# Altium schematic sheet rp2040.SchDoc
size A3
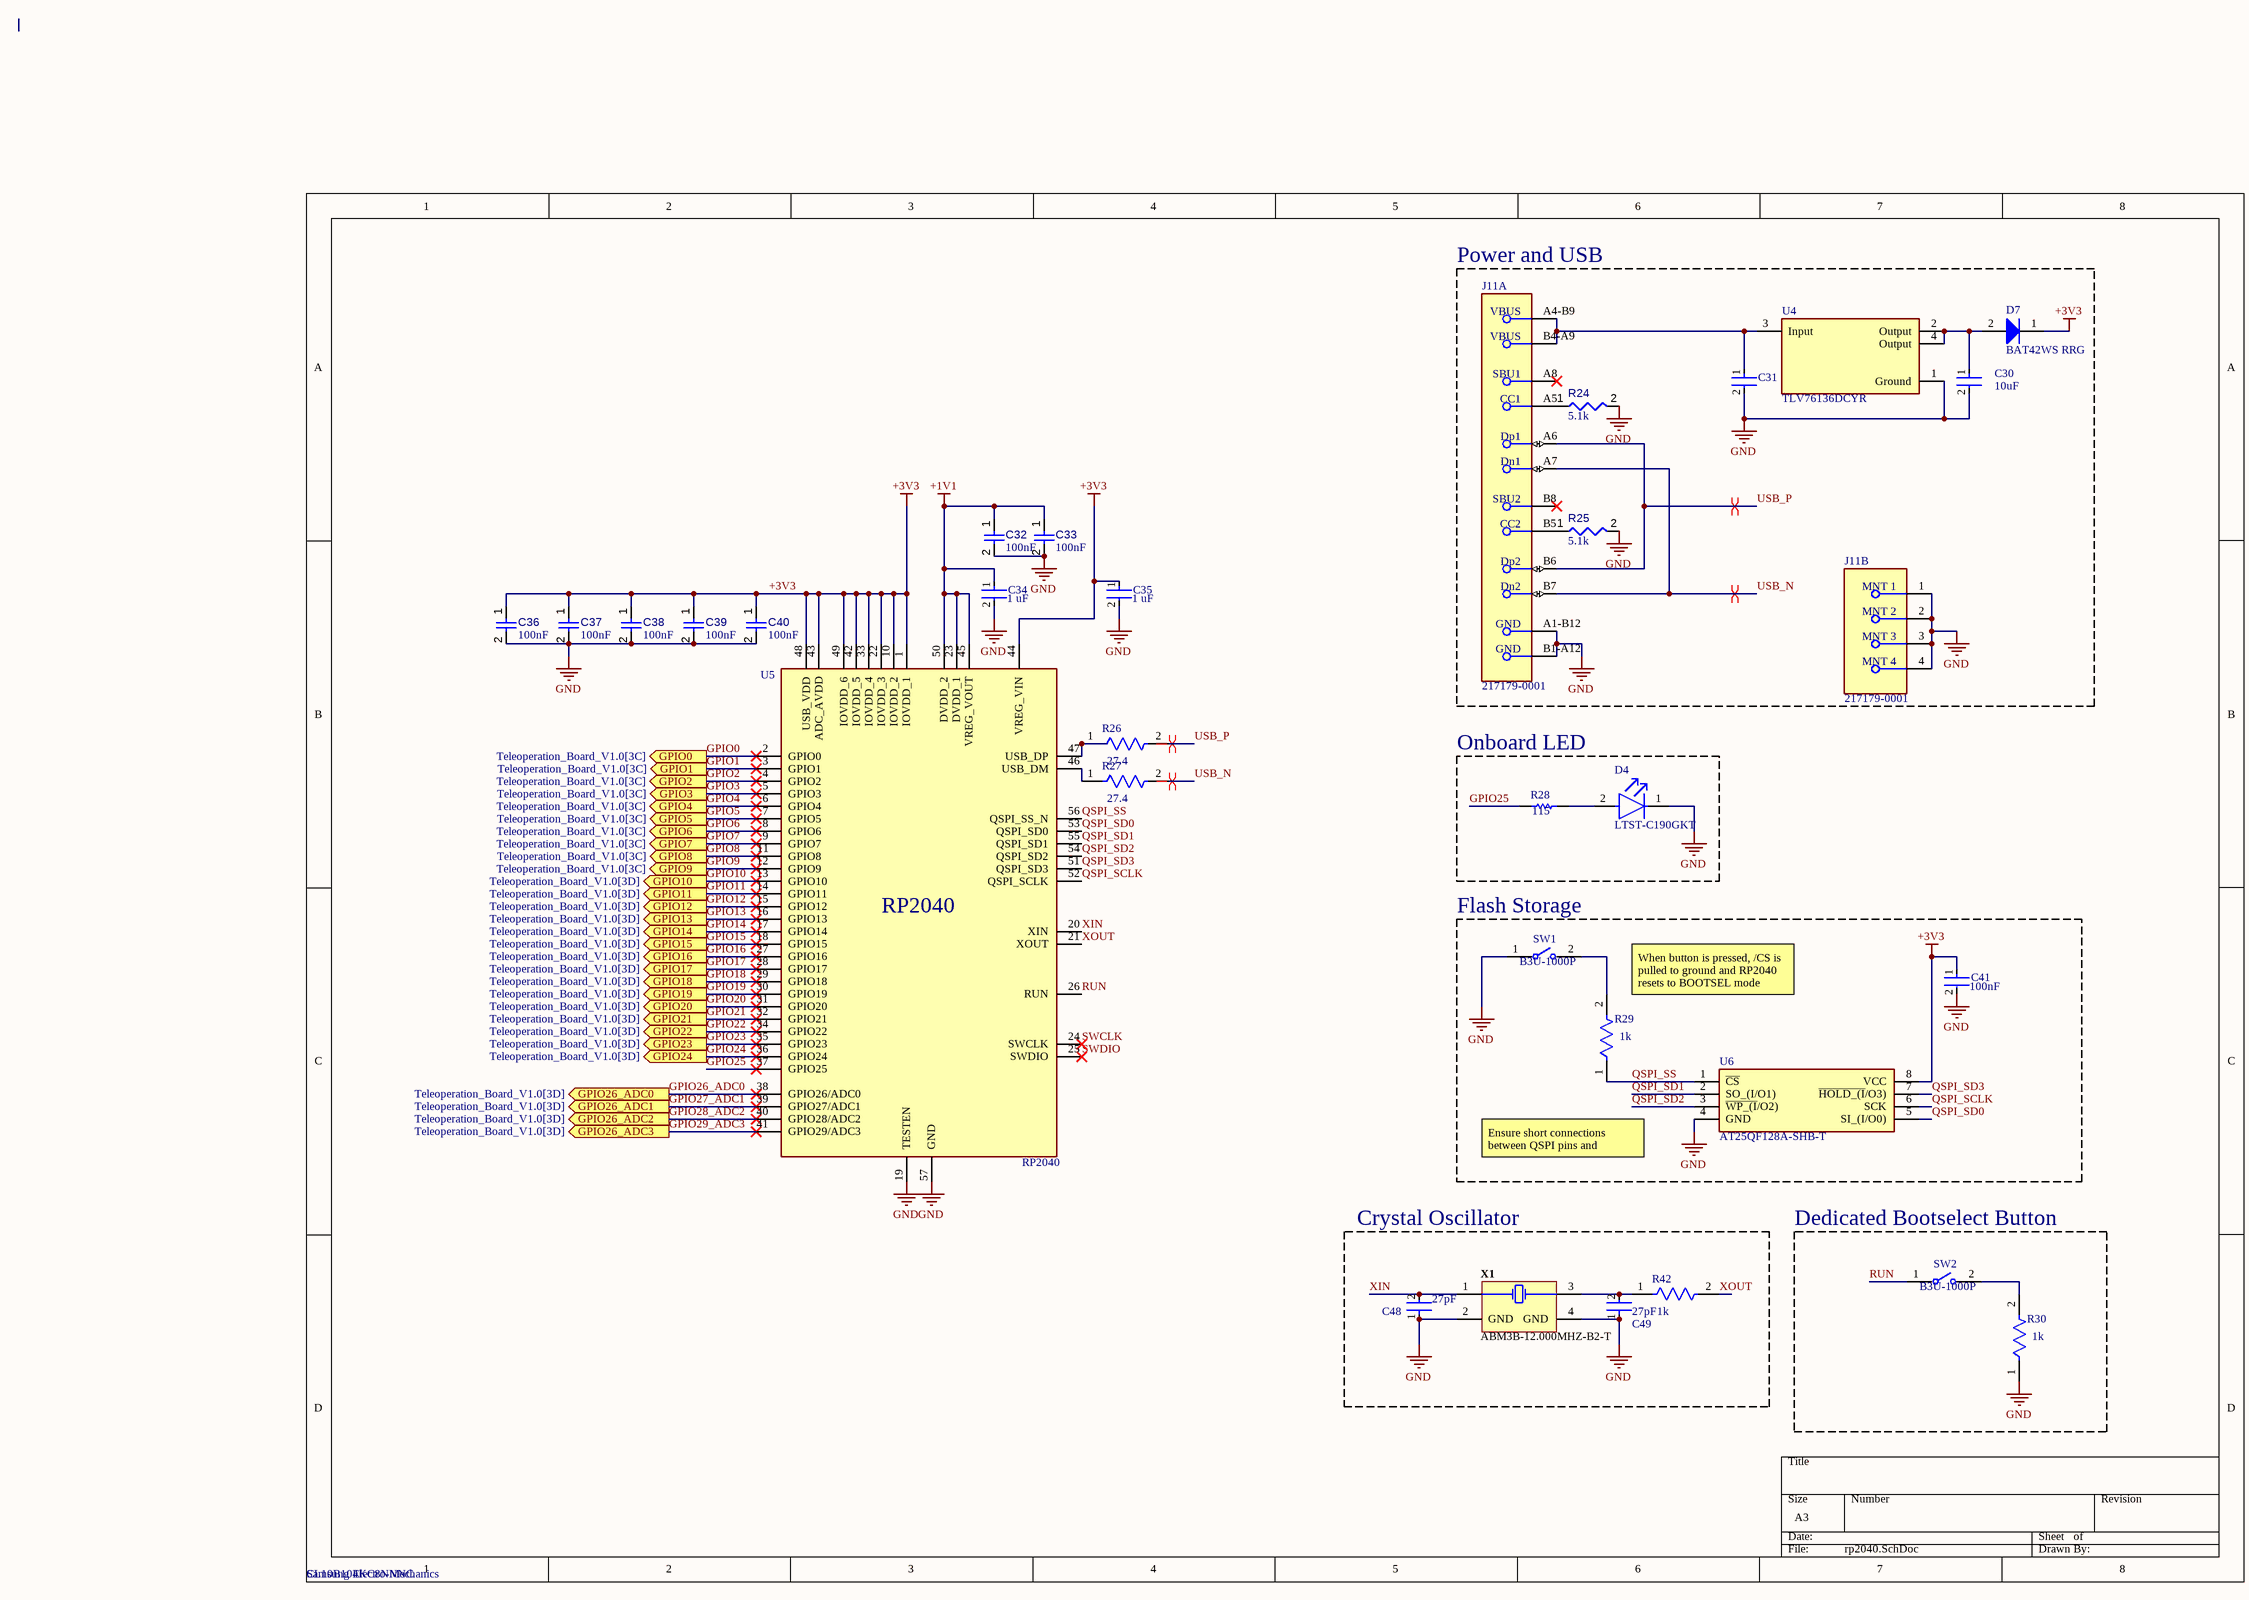
[diagram p0: rp2040.SchDoc]

## Parts
C30  Capacitance: 10uF  [FP-GRT188-0_2-MFG]  (hidden comment: GRT188R61E106ME13D)
C31  UMK107AB7105KA-T  [FP-0603-L_1_6_0_15-W_0_8-IPC_C]  (value not drawn)
C32  value 100nF  [CAPC1608X90N]  (hidden comment: CL10B104KC8NNNC)
C33  value 100nF  [CAPC1608X90N]  (hidden comment: CL10B104KC8NNNC)
C34  CC0603KPX7R7BB105  [FP-CC0603-DA-MFG]  (value not drawn)
C35  CC0603KPX7R7BB105  [FP-CC0603-DA-MFG]  (value not drawn)
C36  value 100nF  [CAPC1608X90N]  (hidden comment: CL10B104KC8NNNC)
C37  value 100nF  [CAPC1608X90N]  (hidden comment: CL10B104KC8NNNC)
C38  value 100nF  [CAPC1608X90N]  (hidden comment: CL10B104KC8NNNC)
C39  value 100nF  [CAPC1608X90N]  (hidden comment: CL10B104KC8NNNC)
C40  value 100nF  [CAPC1608X90N]  (hidden comment: CL10B104KC8NNNC)
C41  Manufacturer: Samsung Electro-Mechanics  [FP-CGA3E-0_3-0_1-IPC_A]  (hidden comment: CL10B104KC8NNNC)
C48  C0603C270J5GACTU  [FP-C0603C-CF-MFG]  (value not drawn)
C49  C0603C270J5GACTU  [FP-C0603C-CF-MFG]  (value not drawn)
D4  LTST-C190GKT  [FP-LTST-C190GKT-MFG]
D7  BAT42WS RRG  [BAT42WS RRG-Footprint-1]
J11  217179-0001  [FP-2171790001-MFG]  (parts A,B of 2)
R24  value 5.1k  [RESC1608X55N]  (hidden comment: ERJ-3EKF5101V)
R25  value 5.1k  [RESC1608X55N]  (hidden comment: ERJ-3EKF5101V)
R26  CRCW060327R4FKEA  [FP-CRCW0603-e3-MFG]  (value not drawn)
R27  CRCW060327R4FKEA  [FP-CRCW0603-e3-MFG]  (value not drawn)
R28  ERJ-3EKF1150V  [RESC1608X55X30NL15T15]  (value not drawn)
R29  RC0603FR-071KL  [FP-RC0603-0_55-IPC_C]  (value not drawn)
R30  RC0603FR-071KL  [FP-RC0603-0_55-IPC_C]  (value not drawn)
R42  RC0603FR-071KL  [FP-RC0603-0_55-IPC_C]  (value not drawn)
SW1  B3U-1000P  [FP-B3U-1000P-MFG]
SW2  B3U-1000P  [FP-B3U-1000P-MFG]
U4  TLV76136DCYR  [TLV76136DCYR-Footprint-1]
U5  RP2040  [RP2040TR7]
U6  AT25QF128A-SHB-T  [SOIC127P790X216-8N]
X1  ABM3B-12.000MHZ-B2-T  [ABRA-ABM3B-4_V]

## Blocks framed on the sheet
Power and USB: C30 C31 D7 J11 R24 R25 U4
Onboard LED: D4 R28
Flash Storage: C41 R29 SW1 U6
Crystal Oscillator: C48 C49 R42 X1
Dedicated Bootselect Button: R30 SW2

## Ports
GPIO0 (out, see Teleoperation_Board_V1.0[3C]), GPIO1 (out, see Teleoperation_Board_V1.0[3C]), GPIO2 (out, see Teleoperation_Board_V1.0[3C]), GPIO3 (out, see Teleoperation_Board_V1.0[3C]), GPIO4 (out, see Teleoperation_Board_V1.0[3C]), GPIO5 (out, see Teleoperation_Board_V1.0[3C]), GPIO6 (out, see Teleoperation_Board_V1.0[3C]), GPIO7 (out, see Teleoperation_Board_V1.0[3C]), GPIO8 (out, see Teleoperation_Board_V1.0[3C]), GPIO9 (out, see Teleoperation_Board_V1.0[3C]), GPIO10 (out, see Teleoperation_Board_V1.0[3D]), GPIO11 (out, see Teleoperation_Board_V1.0[3D]), GPIO12 (out, see Teleoperation_Board_V1.0[3D]), GPIO13 (out, see Teleoperation_Board_V1.0[3D]), GPIO14 (out, see Teleoperation_Board_V1.0[3D]), GPIO15 (out, see Teleoperation_Board_V1.0[3D]), GPIO16 (out, see Teleoperation_Board_V1.0[3D]), GPIO17 (out, see Teleoperation_Board_V1.0[3D]), GPIO18 (out, see Teleoperation_Board_V1.0[3D]), GPIO19 (out, see Teleoperation_Board_V1.0[3D]), GPIO20 (out, see Teleoperation_Board_V1.0[3D]), GPIO21 (out, see Teleoperation_Board_V1.0[3D]), GPIO22 (out, see Teleoperation_Board_V1.0[3D]), GPIO23 (out, see Teleoperation_Board_V1.0[3D]), GPIO24 (out, see Teleoperation_Board_V1.0[3D]), GPIO26_ADC0 (out, see Teleoperation_Board_V1.0[3D]), GPIO26_ADC1 (out, see Teleoperation_Board_V1.0[3D]), GPIO26_ADC2 (out, see Teleoperation_Board_V1.0[3D]), GPIO26_ADC3 (out, see Teleoperation_Board_V1.0[3D])

## Nets
+1V1: C32.1 C33.1 C34.1 U5.23(DVDD_1) U5.45(VREG_VOUT) U5.50(DVDD_2)
+3V3: C35.1 C36.1 C37.1 C38.1 C39.1 C40.1 C41.1 D7.1(K) U5.1(IOVDD_1) U5.10(IOVDD_2) U5.22(IOVDD_3) U5.33(IOVDD_4) U5.42(IOVDD_5) U5.43(ADC_AVDD) U5.44(VREG_VIN) U5.48(USB_VDD) U5.49(IOVDD_6) U6.8(VCC)
GND: C30.2 C31.2 C32.2 C33.2 C34.2 C35.2 C36.2 C37.2 C38.2 C39.2 C40.2 C41.2 C48.1 C49.1 D4.1(C) J11.1(MNT_1) J11.2(MNT_2) J11.3(MNT_3) J11.4(MNT_4) J11.A1-B12(GND) J11.B1-A12(GND) R24.2 R25.2 R30.1 SW1.1 U4.1(Ground) U5.19(TESTEN) U5.57(GND) U6.4(GND) X1.2(GND) X1.4(GND)
GPIO0: U5.2(GPIO0) ; port GPIO0
GPIO1: U5.3(GPIO1) ; port GPIO1
GPIO2: U5.4(GPIO2) ; port GPIO2
GPIO3: U5.5(GPIO3) ; port GPIO3
GPIO4: U5.6(GPIO4) ; port GPIO4
GPIO5: U5.7(GPIO5) ; port GPIO5
GPIO6: U5.8(GPIO6) ; port GPIO6
GPIO7: U5.9(GPIO7) ; port GPIO7
GPIO8: U5.11(GPIO8) ; port GPIO8
GPIO9: U5.12(GPIO9) ; port GPIO9
GPIO10: U5.13(GPIO10) ; port GPIO10
GPIO11: U5.14(GPIO11) ; port GPIO11
GPIO12: U5.15(GPIO12) ; port GPIO12
GPIO13: U5.16(GPIO13) ; port GPIO13
GPIO14: U5.17(GPIO14) ; port GPIO14
GPIO15: U5.18(GPIO15) ; port GPIO15
GPIO16: U5.27(GPIO16) ; port GPIO16
GPIO17: U5.28(GPIO17) ; port GPIO17
GPIO18: U5.29(GPIO18) ; port GPIO18
GPIO19: U5.30(GPIO19) ; port GPIO19
GPIO20: U5.31(GPIO20) ; port GPIO20
GPIO21: U5.32(GPIO21) ; port GPIO21
GPIO22: U5.34(GPIO22) ; port GPIO22
GPIO23: U5.35(GPIO23) ; port GPIO23
GPIO24: U5.36(GPIO24) ; port GPIO24
GPIO25: R28.1 U5.37(GPIO25)
GPIO26_ADC0: U5.38(GPIO26/ADC0) ; port GPIO26_ADC0
GPIO27_ADC1: U5.39(GPIO27/ADC1) ; port GPIO26_ADC1
GPIO28_ADC2: U5.40(GPIO28/ADC2) ; port GPIO26_ADC2
GPIO29_ADC3: U5.41(GPIO29/ADC3) ; port GPIO26_ADC3
QSPI_SCLK: U5.52(QSPI_SCLK) U6.6(SCK)
QSPI_SD0: U5.53(QSPI_SD0) U6.5(SI_(I/O0))
QSPI_SD1: U5.55(QSPI_SD1) U6.2(SO_(I/O1))
QSPI_SD2: U5.54(QSPI_SD2) U6.3(~{WP_(I}/O2))
QSPI_SD3: U5.51(QSPI_SD3) U6.7(~{HOLD_(I}/O3))
QSPI_SS: R29.1 U5.56(QSPI_SS_N) U6.1(~{CS})
RUN: SW2.1 U5.26(RUN)
SWCLK: U5.24(SWCLK)
SWDIO: U5.25(SWDIO)
USB_N: J11.A7(Dn1) J11.B7(Dn2) R27.2
USB_P: J11.A6(Dp1) J11.B6(Dp2) R26.2
XIN: C48.2 U5.20(XIN) X1.1(X1)
XOUT: R42.2 U5.21(XOUT)
NetC30_1: C30.1 D7.2(A) U4.2(Output) U4.4(Output)
NetC31_1: C31.1 J11.A4-B9(VBUS) J11.B4-A9(VBUS) U4.3(Input)
NetC49_2: C49.2 R42.1 X1.3(X2)
NetD4_2: D4.2(A) R28.2
NetJ11_A5: J11.A5(CC1) R24.1
NetJ11_B5: J11.B5(CC2) R25.1
NetR26_1: R26.1 U5.47(USB_DP)
NetR27_1: R27.1 U5.46(USB_DM)
NetR29_2: R29.2 SW1.2
NetR30_2: R30.2 SW2.2

Not connected (* = marked no-connect by the designer): J11 A8(SBU1)* B8(SBU2)*

## Layout directives
differential pair: (no net found under the mark), USB_N, USB_P

## Notes on the sheet
- (near C34) 1 uF
- (near C35) 1 uF
- 27.4
- (near R27) 27.4
- (near R28) 115
- (near U5) RP2040
- (near R29) 1k
- (near R29) When button is pressed, /CS is pulled to ground and RP2040 resets to BOOTSEL mode
- (near C41) 100nF
- Ensure short connections between QSPI pins and RP2040
- (near C48) 27pF
- 27pF
- (near R42) 1k
- (near R30) 1k

## Library data of the parts
C30 = CMP-06035-032378-1: Multi-Layer Ceramic Capacitor 10uF 25V X5R ±20% 0603 Paper T/R; Thickness: 0.035inch; Case/Package: 0603; Voltage Rating: 25V; Mount: Surface Mount; Packaging: Tape and Reel; Width: 0.031inch; Max Operating Temperature: 85°C; Case Code (Imperial): 0603; Ratings: AEC-Q200; Tolerance: 20%; Min Operating Temperature: -55°C; Case Code (Metric): 1608; Length: 0.063inch
C31 = CMP-2000-07531-4: Ceramic Capacitor General Use 1uF ±10% 50V X7R 0603; Series: M; Width: 0.031inch; Mount: Surface Mount; Radiation Hardening: No; Voltage Rating (DC): 50V; Packaging: Tape and Reel; Termination: SMD/SMT; Depth: 0.8mm; Case Code (Metric): 1608; Case Code (Imperial): 0603; Height: 0.8mm; Voltage Rating: 50V; Package Quantity: 1; Halogen Free: Halogen Free; Dielectric: X7R; Min Operating Temperature: -55°C; Length: 1.6mm; Construction: Flat; Tolerance: 10%; Thickness: 0.037inch; Max Operating Temperature: 125°C; Case/Package: 0603; Capacitance: 1uF; RoHS Compliant: Yes
C32 C33 C36-C40 = CMP-001-00090-1: Ceramic Capacitor, Multilayer, Ceramic, 100V, 10% +Tol, 10% -Tol, X7R, 15% TC, 0.1uF, Surface Mount, 0603; Case/Package: 0603; Min Operating Temperature: -55°C; Mounting Technology: Surface Mount; Capacitor Type: Ceramic; Max Operating Temperature: 125°C; Pins: 2; RoHS Compliant: Yes
C34 C35 = CMP-03422-001047-1: CC0603 1 uF X7R 10.00% 16 V; Manufacturer: YAGEO; Temperature Coefficient: 15%; Tolerance: 0.1; Voltage Rating: 16 V; Capacitance: 1 uF; Material: Ceramic; Value: 1 uF; Device Class L3: Ceramic Capacitors; Temperature Characteristic: X7R; Device Class L2: Capacitors; Temperature Range Low: -55°C; Footprint Url: http://www.yageo.com/exep/pages/download/literatures/UPY-C_GEN_24.pdf; Device Class L1: Passive Components; Temperature: -55°C to +125°C; RoHS: TRUE; ComponentLink2URL: http://www.yageo.com/documents/recent/UPY-GPHC_X7R_6.3V-to-50V_18.pdf; Mouser Description: Cap Ceramic 1uF 16V X7R 10% SMD 0603 125°C Paper T/R; Octopart: https://octopart.com/cc0603kpx7r7bb105-yageo-25629533; Automotive: No; Height: 0.9mm; Voltage: 16 V; Lead Free: Yes; Category: Cap; Package: CC0603-DA; Temperature Range High: +125°C; Manufacturer Part Number: CC0603KPX7R7BB105; ComponentLink2Description: Datasheet
C41 = CMP-2000-07546-2: Cap Ceramic 100nF 50V X7R 10% Pad SMD 0603 +125°C Automotive T/R; Weight: 7.1E-05oz; Composition: Ceramic; Max Operating Temperature: 125°C; Termination: SMD/SMT; Dielectric: X7R; Length: 1.6mm; Package Quantity: 1; REACH SVHC: No SVHC; Lead Free: Lead Free; Case Code (Metric): 1608; Min Operating Temperature: -55°C; Packaging: Tape and Reel; Tolerance: 10%; Voltage Rating: 50V; Case Code (Imperial): 0603; Capacitance: 100nF; Case/Package: 0603; Voltage Rating (DC): 50V; Depth: 0.8mm; Radiation Hardening: No; Ratings: AEC-Q200; Mount: Surface Mount; Voltage: 50V; Thickness: 0.035inch; Width: 0.8mm; Height: 0.8mm; Manufacturer Part Number: CL10B104KC8NNNC
C48 C49 = CMP-2006-03314-2: CAP CER 27PF 50V C0G/NP0 0603; Manufacturer: KEMET; Tolerance: 0.05; Material: Ceramic; Automotive Grade: Grade 1; Temperature Characteristic: C0G; Temperature Coefficient: 30ppm/°C; RoHS: TRUE; Lead Free: Yes; Automotive: Yes; Category: Cap; Digikey Description: CAP CER 27PF 50V C0G/NP0 0603; Device Class L3: Ceramic Capacitors; Capacitance: 27 pF; Temperature Range High: +125°C; Octopart: https://octopart.com/c0603c270j5gactu-kemet-136059; Value: 27 pF; Temperature Range Low: -55°C; ComponentLink2URL: https://api.kemet.com/component-edge/download/datasheet/C0603C100J5GACAUTO.pdf; Device Class L2: Capacitors; Mouser Description: Multilayer Ceramic Capacitors MLCC - SMD/SMT 50volts 27pF C0G 5%; Device Class L1: Passive Components; ComponentLink2Description: Datasheet; Voltage Rating: 50 V; Package: C0603C-CF; Height: 0.87mm; Temperature: -55°C to +125°C; Manufacturer Part Number: C0603C270J5GACTU
D4 = CMP-22017-000005-2: LED GREEN CLEAR CHIP SMD; Dominant Wavelength: 569nm; Reverse Voltage: 5V; Lens Color: Colorless; Viewing Angle: 130°; Voltage: 2V; Forward Current: 30mA; Power Dissipation: 100mW; Luminous Intensity: 6mcd; Number of LEDs: 1; Forward Voltage: 2.1V; Wavelength: 565nm; Test Current: 10mA; Min Operating Temperature: -55°C; Lens Style: Clear; Mount: Surface Mount; Width: 0.8mm; Packaging: Tape and Reel; Lens Transparency: Clear; Case Code (Metric): 1608; Depth: 0.8mm; Case Code (Imperial): 0603; Case/Package: 0603; Number of Pins: 2; Max Operating Temperature: 85°C; Lead Free: Lead Free; Number of Elements: 1; Length: 1.6mm; Height: 0.8mm; Package Quantity: 1; Power Rating: 100mW; Radiation Hardening: No; Illumination Color: Green; Color: Green
D7 = CMP-004-00032-1: Schottky Diode, 30V, 0.2A, Sod-323F Rohs Compliant: Yes; Manufacturer Lifecycle Status: ACTIVE; Lifecycle Status: Production
J11 = CMP-04767-000028-2: CONN RCP USB2.0 TYP C 24P SMD RA; NexarPartId: 117190526; Gender: Receptacle; Number of Contacts: 16; Current Rating: 1.25A; Voltage Rating: 30V; Min Operating Temperature: -40°C; USB Standard: USB 2.0; Height: 3.36mm; Contact Material: Gold, Nickel; Max Operating Temperature: 85°C
R24 R25 = CMP-009-00178-1: Fixed Resistor, Metal Glaze/thick Film, 0.1W, 5100ohm, 75V, 1% +/-Tol, 100ppm/Cel, Surface Mount, 0603; Power: 100mW; Case/Package: 0603; Tolerance: 1%; Min Operating Temperature: -55°C; Max Operating Temperature: 155°C; RoHS Compliant: Yes; Mounting Technology: Surface Mount; Pins: 2
R26 R27 = CMP-2000-03146-2: RES Thick Film, 27.4Ω, 1%, 0.1W, 100ppm/°C, 0603; Voltage Rating (DC): 75V; Max Power Dissipation: 100mW; Resistance: 27.4R; Case Code (Metric): 1608; Length: 1.55mm; Depth: 0.85mm; Package Quantity: 10; Voltage Rating: 75V; Power Rating: 100mW; Weight: 7.1E-05oz; Max Operating Temperature: 155°C; Temperature Coefficient: 100ppm/°C; Packaging: Tape and Reel; Lead Free: Lead Free; Number of Pins: 2; Height: 0.45mm; Military Standard: Not; Features: Automotive AEC-Q200; Contact Plating: Tin; Min Operating Temperature: -55°C; Composition: Thick Film; Mount: Surface Mount; Case/Package: 0603; Case Code (Imperial): 0603; Tolerance: 1%; Width: 0.85mm; Radiation Hardening: No; Number of Terminations: 2; Termination: SMD/SMT
R28 = CMP-2000-00205-1: Manufacturer: Panasonic; Part Number: ERJ-3EKF1150V
R29 R30 R42 = CMP-1659-00009-5: RES 1K OHM 1% 1/10W 0603; Resistance: 1kR; Voltage Rating: 50V; Power Rating: 100mW; Temperature Coefficient: 100ppm/°C; Military Standard: Not; REACH SVHC: No SVHC; Size Code: 0603; Features: Moisture Resistant; Number of Terminations: 2; Technology: THICK FILM; Series: RC; Case Code (Metric): 1608; Resistance Tolerance: 1%; Resistor Type: Thick Film; Termination: SMD/SMT; Contact Plating: Tin; Radiation Hardening: No; Min Operating Temperature: -55°C; Max Operating Temperature: 155°C; Packaging: Tape and Reel; Max Power Dissipation: 100mW; RoHS Compliant: Yes; Height: 0.45mm; Lead Free: Lead Free; Case/Package: 0603; Length: 1.6mm; Tolerance: 1%; Case Code (Imperial): 0603; Construction: Rectangular; Depth: 0.8mm
SW1 SW2 = CMP-2100-03586-2: SWITCH TACTILE SPST-NO 0.05A 12V; Contact Resistance: 100mR; Operating Force: 1.5N; Max Current Rating: 50mA; Switch Travel: 0.15mm; Actuator Type: Standard; Mechanical Life: 200000Cycles; Ratings: Dust Proof; Illumination Type: Non-Illuminated; Throw Configuration: SPST; Actuator Length: 0.4mm; Switch Function: Off-Mom; Height: 1.2mm; Width: 3mm; Weight: 0.000776oz; Contact Material: Silver; Max Voltage Rating (DC): 12V; Insulation Resistance: 100MR; Lead Free: Lead Free; Current Rating: 50mA; Termination: SMD/SMT; Length: 4mm; Voltage Rating (DC): 12V; Contact Current Rating: 50mA; Orientation: Straight; Depth: 2.5mm; Max Operating Temperature: 70°C; Packaging: Tape and Reel; Min Operating Temperature: -25°C; Package Quantity: 1; Mount: Surface Mount; Electrical Life: 200000Cycles
U4 = CMP-019-00054-3: 1A 16V high-PSRR linear voltage regulator 4-SOT-223 -40 to 125; Manufacturer Lifecycle Status: ACTIVE; Length: 6.5mm; RoHS: Compliant; Thickness: 1.6mm; Width: 3.5mm; Case/Package: SOT-223; Lifecycle Status: Production; Pins: 4; Height: 1.8mm
U5 = RP2040: Integrated Circuit; Manufacturer_Name: RASPBERRY-PI; Datasheet Link: https://datasheets.raspberrypi.org/rp2040/rp2040-datasheet.pdf; Height: 0.9mm; Manufacturer_Part_Number: RP2040
U6 = AT25QF128A-SHB-T: Integrated Circuit; Manufacturer_Name: Renesas Electronics; Datasheet Link: https://www.renesas.com/us/en/products/memory-logic/non-volatile-memory/spi-nor-flash/dual-quad-spi-memory/at25qf128a-128mbit-3v-spi-serial-flash-memory-dual-io-and-quad-io-support; Height: 2.16mm; Manufacturer_Part_Number: AT25QF128A-SHB-T; Mouser Part Number: 988-AT25QF128A-SHB-T; Mouser Price/Stock: https://www.mouser.co.uk/ProductDetail/Renesas-Dialog/AT25QF128A-SHB-T?qs=IS%252B4QmGtzzpXzyCQuAC%2FQA%3D%3D
X1 = CMP-003-00015-2: Ceramic SMD Crystal, 12 MHz, +/- 20 ppm, 18 pF, -20 to 70 degC, 4-Pin SMD, RoHS, Tape and Reel; Manufacturer: Abracon; ESR: 70; Load Capacitance: 18pF; Tolerance: 20ppm; Frequency: 12MHz; Resistance: 70Ohm; Mounting Technology: SM; Packaging: TapeandReel; Datasheet URL: http://www.abracon.com/Resonators/abm3b.pdf; Manufacturer URL: http://www.abracon.com/; RoHS Compliant: True; Frequency Tolerance: 20ppm; Datasheet Version: Aug-15; Max Operating Temperature: 70°C; Package Reference: ABM3B; Min Operating Temperature: -20°C; Pins: 4; Package Quantity: 1000; Package Description: 4-Pin Surface Mount Device, Body 5 x 3.2 mm; Case/Package: CSMD